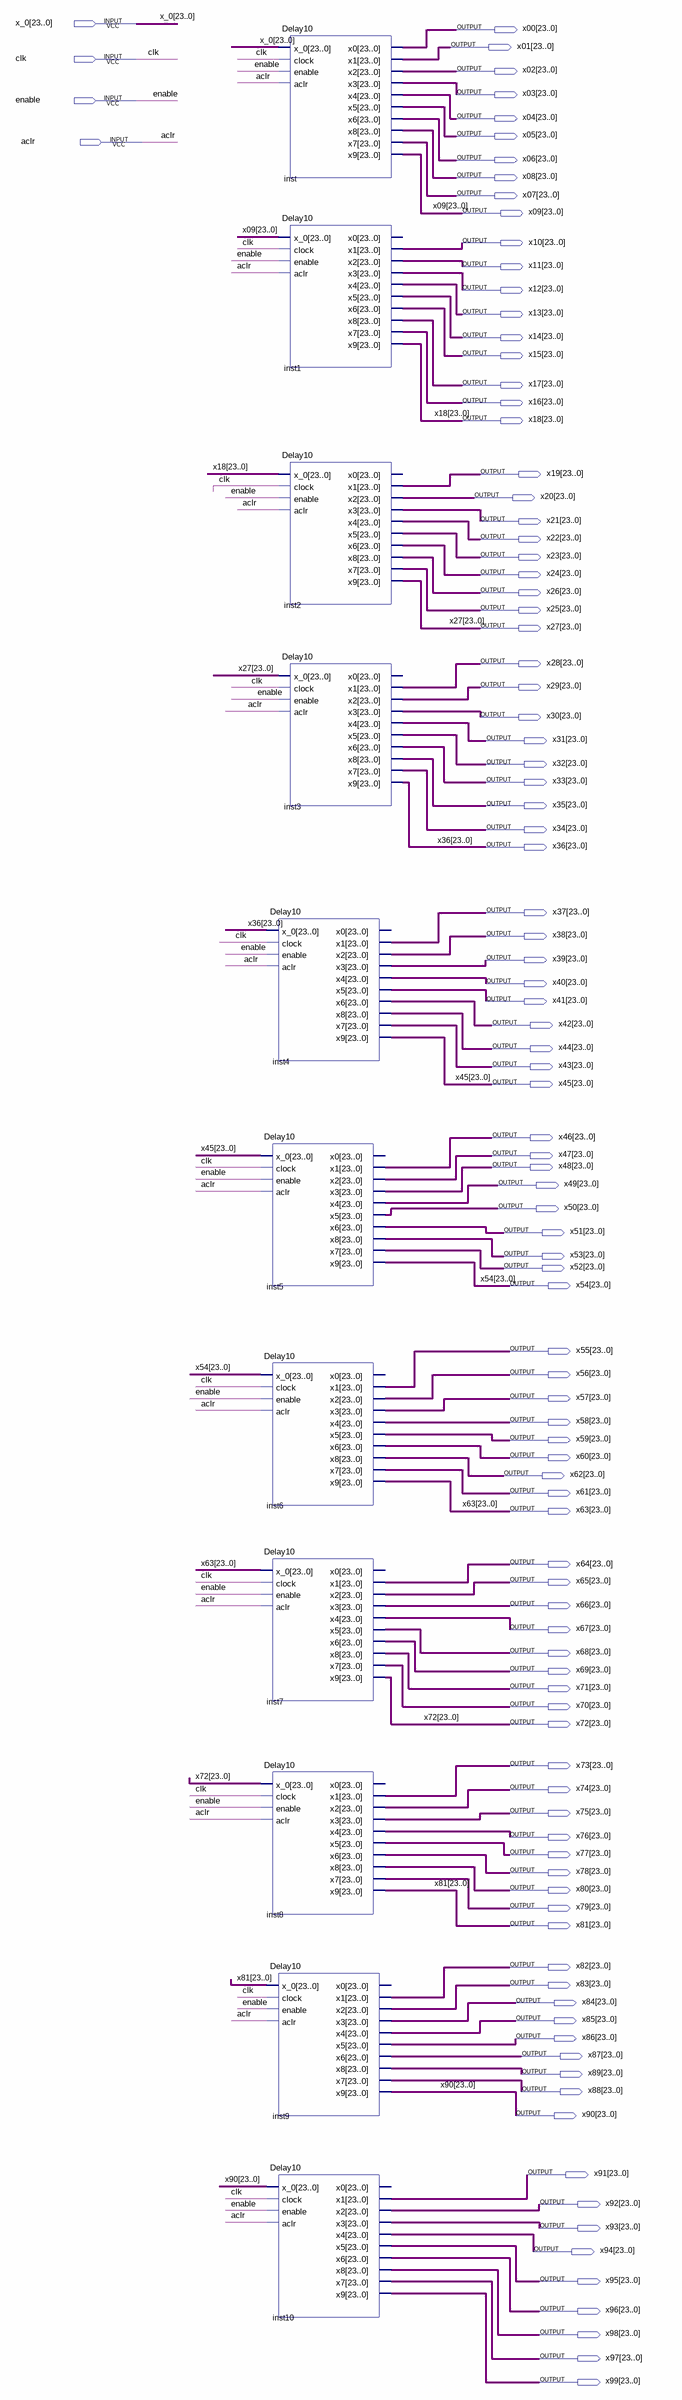
[diagram p0: schematic sheet]
// Quartus schematic 100lowpassfilter.bdf as structural Verilog: 11 symbols, 104 pins
module \100lowpassfilter  (
  input  [23:0] x_0,
  input  clk,
  input  enable,
  input  aclr,
  output [23:0] x00,
  output [23:0] x01,
  output [23:0] x02,
  output [23:0] x03,
  output [23:0] x04,
  output [23:0] x05,
  output [23:0] x06,
  output [23:0] x08,
  output [23:0] x07,
  output [23:0] x09,
  output [23:0] x10,
  output [23:0] x11,
  output [23:0] x12,
  output [23:0] x13,
  output [23:0] x14,
  output [23:0] x15,
  output [23:0] x17,
  output [23:0] x16,
  output [23:0] x18,
  output [23:0] x19,
  output [23:0] x20,
  output [23:0] x21,
  output [23:0] x22,
  output [23:0] x23,
  output [23:0] x24,
  output [23:0] x26,
  output [23:0] x25,
  output [23:0] x27,
  output [23:0] x28,
  output [23:0] x29,
  output [23:0] x30,
  output [23:0] x31,
  output [23:0] x32,
  output [23:0] x33,
  output [23:0] x35,
  output [23:0] x34,
  output [23:0] x36,
  output [23:0] x37,
  output [23:0] x38,
  output [23:0] x39,
  output [23:0] x40,
  output [23:0] x41,
  output [23:0] x42,
  output [23:0] x44,
  output [23:0] x43,
  output [23:0] x45,
  output [23:0] x46,
  output [23:0] x47,
  output [23:0] x48,
  output [23:0] x49,
  output [23:0] x50,
  output [23:0] x51,
  output [23:0] x53,
  output [23:0] x52,
  output [23:0] x54,
  output [23:0] x55,
  output [23:0] x56,
  output [23:0] x57,
  output [23:0] x58,
  output [23:0] x59,
  output [23:0] x60,
  output [23:0] x62,
  output [23:0] x61,
  output [23:0] x63,
  output [23:0] x64,
  output [23:0] x65,
  output [23:0] x66,
  output [23:0] x67,
  output [23:0] x68,
  output [23:0] x69,
  output [23:0] x71,
  output [23:0] x70,
  output [23:0] x72,
  output [23:0] x73,
  output [23:0] x74,
  output [23:0] x75,
  output [23:0] x76,
  output [23:0] x77,
  output [23:0] x78,
  output [23:0] x80,
  output [23:0] x79,
  output [23:0] x81,
  output [23:0] x82,
  output [23:0] x83,
  output [23:0] x84,
  output [23:0] x85,
  output [23:0] x86,
  output [23:0] x87,
  output [23:0] x89,
  output [23:0] x88,
  output [23:0] x90,
  output [23:0] x91,
  output [23:0] x92,
  output [23:0] x93,
  output [23:0] x94,
  output [23:0] x95,
  output [23:0] x96,
  output [23:0] x98,
  output [23:0] x97,
  output [23:0] x99
);

  Delay10 inst (
    .x_0(x_0), .clock(clk), .enable(enable), .aclr(aclr), .x0(x00), .x1(x01), .x2(x02), .x3(x03), .x4(x04),
    .x5(x05), .x6(x06), .x8(x08), .x7(x07), .x9(x09));
  Delay10 inst1 (
    .x_0(x09), .clock(clk), .enable(enable), .aclr(aclr), .x1(x10), .x2(x11), .x3(x12), .x4(x13), .x5(x14),
    .x6(x15), .x8(x17), .x7(x16), .x9(x18));  // open: x0
  Delay10 inst2 (
    .x_0(x18), .clock(clk), .enable(enable), .aclr(aclr), .x1(x19), .x2(x20), .x3(x21), .x4(x22), .x5(x23),
    .x6(x24), .x8(x26), .x7(x25), .x9(x27));  // open: x0
  Delay10 inst3 (
    .x_0(x27), .clock(clk), .enable(enable), .aclr(aclr), .x1(x28), .x2(x29), .x3(x30), .x4(x31), .x5(x32),
    .x6(x33), .x8(x35), .x7(x34), .x9(x36));  // open: x0
  Delay10 inst4 (
    .x_0(x36), .clock(clk), .enable(enable), .aclr(aclr), .x1(x37), .x2(x38), .x3(x39), .x4(x40), .x5(x41),
    .x6(x42), .x8(x44), .x7(x43), .x9(x45));  // open: x0
  Delay10 inst5 (
    .x_0(x45), .clock(clk), .enable(enable), .aclr(aclr), .x1(x46), .x2(x47), .x3(x48), .x4(x49), .x5(x50),
    .x6(x51), .x8(x53), .x7(x52), .x9(x54));  // open: x0
  Delay10 inst6 (
    .x_0(x54), .clock(clk), .enable(enable), .aclr(aclr), .x1(x55), .x2(x56), .x3(x57), .x4(x58), .x5(x59),
    .x6(x60), .x8(x62), .x7(x61), .x9(x63));  // open: x0
  Delay10 inst7 (
    .x_0(x63), .clock(clk), .enable(enable), .aclr(aclr), .x1(x64), .x2(x65), .x3(x66), .x4(x67), .x5(x68),
    .x6(x69), .x8(x71), .x7(x70), .x9(x72));  // open: x0
  Delay10 inst8 (
    .x_0(x72), .clock(clk), .enable(enable), .aclr(aclr), .x1(x73), .x2(x74), .x3(x75), .x4(x76), .x5(x77),
    .x6(x78), .x8(x80), .x7(x79), .x9(x81));  // open: x0
  Delay10 inst9 (
    .x_0(x81), .clock(clk), .enable(enable), .aclr(aclr), .x1(x82), .x2(x83), .x3(x84), .x4(x85), .x5(x86),
    .x6(x87), .x8(x89), .x7(x88), .x9(x90));  // open: x0
  Delay10 inst10 (
    .x_0(x90), .clock(clk), .enable(enable), .aclr(aclr), .x1(x91), .x2(x92), .x3(x93), .x4(x94), .x5(x95),
    .x6(x96), .x8(x98), .x7(x97), .x9(x99));  // open: x0
endmodule
